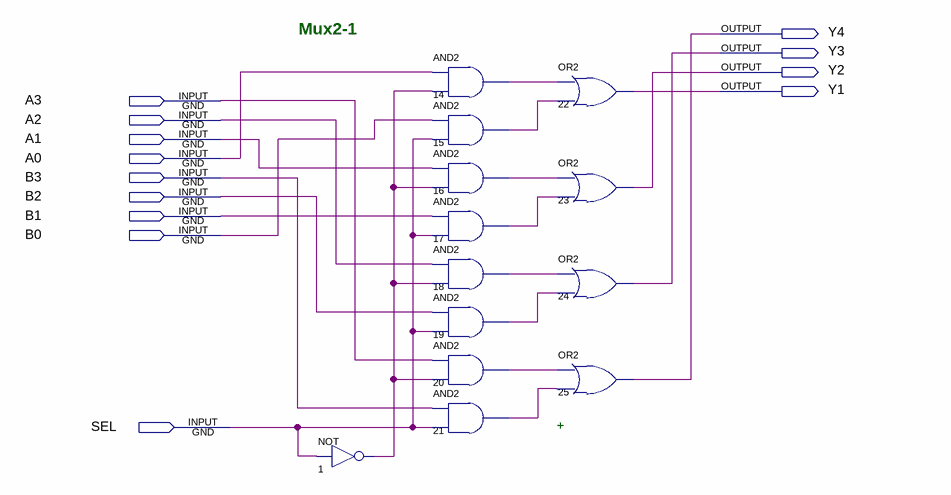
[diagram p0: schematic sheet]
// Quartus schematic bMux2-1.bdf as structural Verilog: 13 symbols, 13 pins
module \bMux2-1  (
  input  A3,
  input  A2,
  input  A1,
  input  A0,
  input  B3,
  input  B2,
  input  B1,
  input  B0,
  input  SEL,
  output Y4,
  output Y3,
  output Y2,
  output Y1
);

  wire n1_out, n14_out, n15_out, n16_out, n17_out, n18_out, n19_out, n20_out, n21_out;

  not u_1 (n1_out, SEL);
  and u_14 (n14_out, A0, n1_out);
  and u_15 (n15_out, B0, SEL);
  and u_16 (n16_out, A1, n1_out);
  and u_17 (n17_out, B1, SEL);
  and u_18 (n18_out, A2, n1_out);
  and u_19 (n19_out, B2, SEL);
  and u_20 (n20_out, A3, n1_out);
  and u_21 (n21_out, B3, SEL);
  or u_22 (Y1, n14_out, n15_out);
  or u_23 (Y2, n16_out, n17_out);
  or u_24 (Y3, n18_out, n19_out);
  or u_25 (Y4, n20_out, n21_out);

  // Notes on the sheet:
  //   Mux2-1
  //   +
endmodule
